# Altium schematic sheet CW341_FPGAIO_3.SchDoc: Kintex IO Banks
size Letter; Organization: NewAE Technology Inc.; Address1: 1083 Queen St., Suite 196; Address2: Halifax; Address3: NS; Address4: Canada B3H 0B2; DocumentNumber: .; Revision: .; SheetNumber: 8; SheetTotal: 16; SheetApproved: No
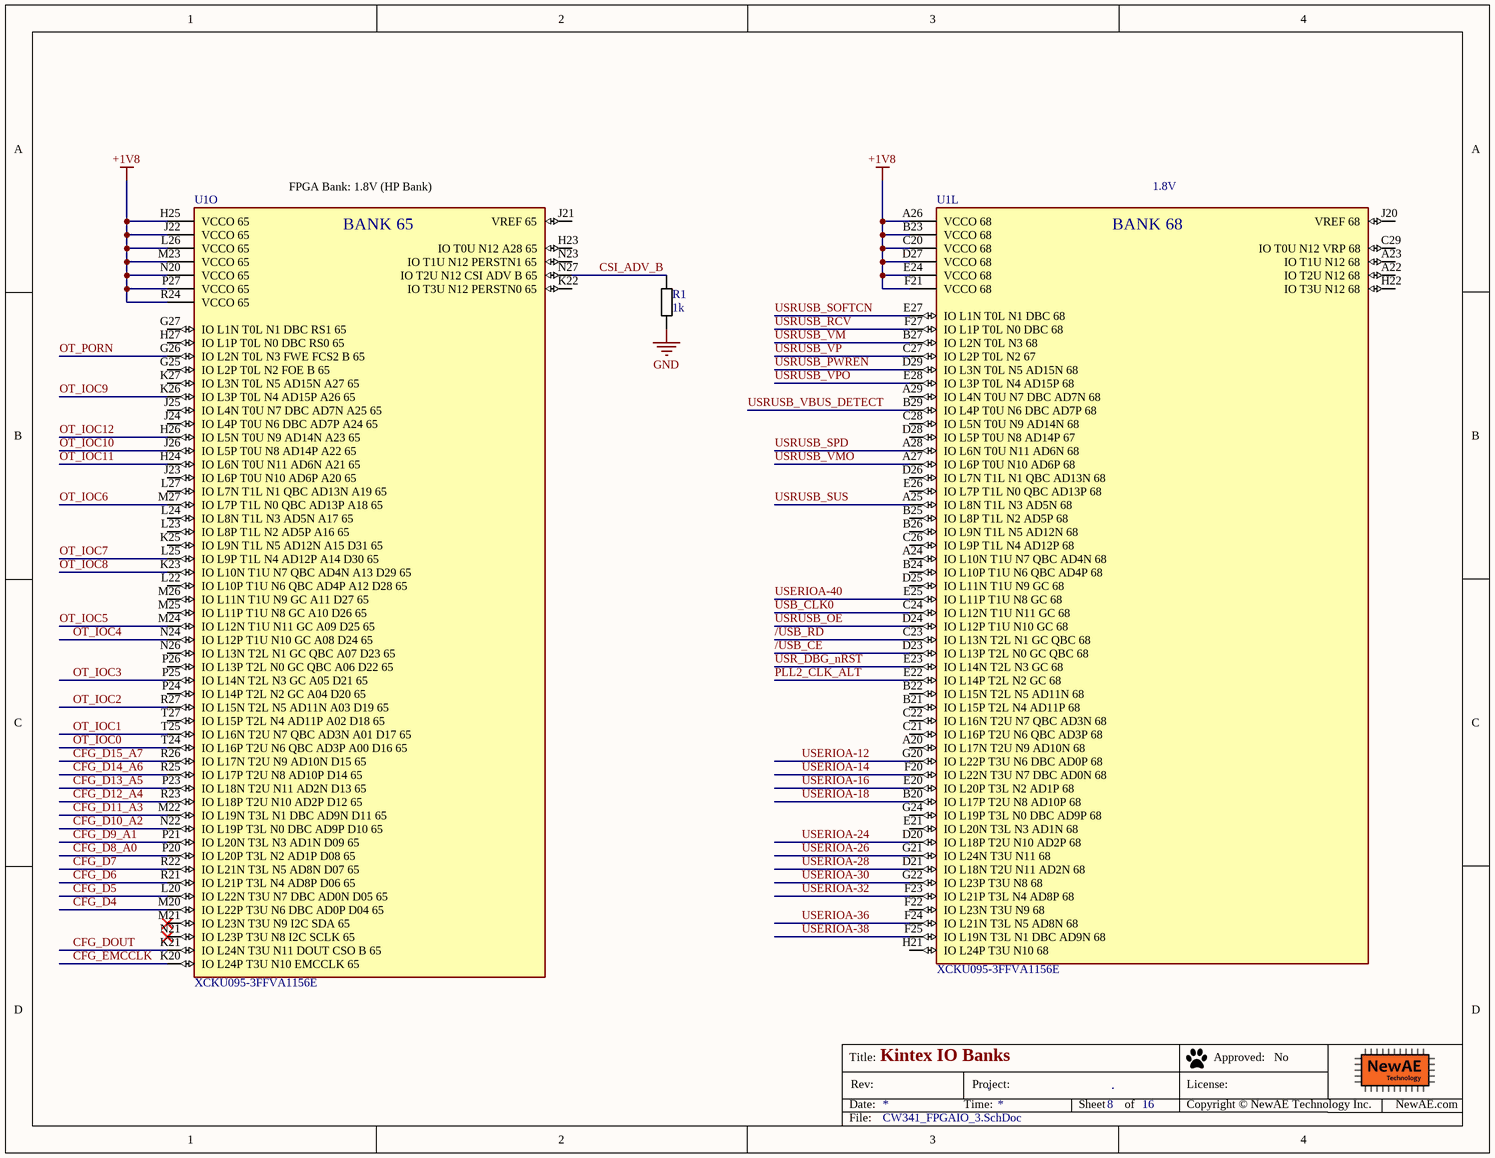
[diagram p0: CW341_FPGAIO_3.SchDoc]

## Parts
R1  1k  [RESC1005X40N]
U1  XCKU095-3FFVA1156E  [FP-XCKU060-3FFVA1156E-MFG]  (parts L,O of 23)

## Nets
+1V8: U1.A26(VCCO_68) U1.B23(VCCO_68) U1.C20(VCCO_68) U1.D27(VCCO_68) U1.E24(VCCO_68) U1.F21(VCCO_68) U1.H25(VCCO_65) U1.J22(VCCO_65) U1.L26(VCCO_65) U1.M23(VCCO_65) U1.N20(VCCO_65) U1.P27(VCCO_65) U1.R24(VCCO_65)
GND: R1.2
/USB_CE: U1.D23(IO_L13P_T2L_N0_GC_QBC_68)
/USB_RD: U1.C23(IO_L13N_T2L_N1_GC_QBC_68)
CFG_D4: U1.M20(IO_L22P_T3U_N6_DBC_AD0P_D04_65)
CFG_D5: U1.L20(IO_L22N_T3U_N7_DBC_AD0N_D05_65)
CFG_D6: U1.R21(IO_L21P_T3L_N4_AD8P_D06_65)
CFG_D7: U1.R22(IO_L21N_T3L_N5_AD8N_D07_65)
CFG_D8_A0: U1.P20(IO_L20P_T3L_N2_AD1P_D08_65)
CFG_D9_A1: U1.P21(IO_L20N_T3L_N3_AD1N_D09_65)
CFG_D10_A2: U1.N22(IO_L19P_T3L_N0_DBC_AD9P_D10_65)
CFG_D11_A3: U1.M22(IO_L19N_T3L_N1_DBC_AD9N_D11_65)
CFG_D12_A4: U1.R23(IO_L18P_T2U_N10_AD2P_D12_65)
CFG_D13_A5: U1.P23(IO_L18N_T2U_N11_AD2N_D13_65)
CFG_D14_A6: U1.R25(IO_L17P_T2U_N8_AD10P_D14_65)
CFG_D15_A7: U1.R26(IO_L17N_T2U_N9_AD10N_D15_65)
CFG_DOUT: U1.K21(IO_L24N_T3U_N11_DOUT_CSO_B_65)
CFG_EMCCLK: U1.K20(IO_L24P_T3U_N10_EMCCLK_65)
CSI_ADV_B: R1.1 U1.N27(IO_T2U_N12_CSI_ADV_B_65)
OT_IOC0: U1.T24(IO_L16P_T2U_N6_QBC_AD3P_A00_D16_65)
OT_IOC1: U1.T25(IO_L16N_T2U_N7_QBC_AD3N_A01_D17_65)
OT_IOC2: U1.R27(IO_L15N_T2L_N5_AD11N_A03_D19_65)
OT_IOC3: U1.P25(IO_L14N_T2L_N3_GC_A05_D21_65)
OT_IOC4: U1.N24(IO_L12P_T1U_N10_GC_A08_D24_65)
OT_IOC5: U1.M24(IO_L12N_T1U_N11_GC_A09_D25_65)
OT_IOC6: U1.M27(IO_L7P_T1L_N0_QBC_AD13P_A18_65)
OT_IOC7: U1.L25(IO_L9P_T1L_N4_AD12P_A14_D30_65)
OT_IOC8: U1.K23(IO_L10N_T1U_N7_QBC_AD4N_A13_D29_65)
OT_IOC9: U1.K26(IO_L3P_T0L_N4_AD15P_A26_65)
OT_IOC10: U1.J26(IO_L5P_T0U_N8_AD14P_A22_65)
OT_IOC11: U1.H24(IO_L6N_T0U_N11_AD6N_A21_65)
OT_IOC12: U1.H26(IO_L5N_T0U_N9_AD14N_A23_65)
OT_PORN: U1.G26(IO_L2N_T0L_N3_FWE_FCS2_B_65)
PLL2_CLK_ALT: U1.E22(IO_L14P_T2L_N2_GC_68)
USB_CLK0: U1.C24(IO_L12N_T1U_N11_GC_68)
USERIOA-12: U1.G20(IO_L22P_T3U_N6_DBC_AD0P_68)
USERIOA-14: U1.F20(IO_L22N_T3U_N7_DBC_AD0N_68)
USERIOA-16: U1.E20(IO_L20P_T3L_N2_AD1P_68)
USERIOA-18: U1.B20(IO_L17P_T2U_N8_AD10P_68)
USERIOA-24: U1.D20(IO_L18P_T2U_N10_AD2P_68)
USERIOA-26: U1.G21(IO_L24N_T3U_N11_68)
USERIOA-28: U1.D21(IO_L18N_T2U_N11_AD2N_68)
USERIOA-30: U1.G22(IO_L23P_T3U_N8_68)
USERIOA-32: U1.F23(IO_L21P_T3L_N4_AD8P_68)
USERIOA-36: U1.F24(IO_L21N_T3L_N5_AD8N_68)
USERIOA-38: U1.F25(IO_L19N_T3L_N1_DBC_AD9N_68)
USERIOA-40: U1.E25(IO_L11P_T1U_N8_GC_68)
USR_DBG_nRST: U1.E23(IO_L14N_T2L_N3_GC_68)
USRUSB_OE: U1.D24(IO_L12P_T1U_N10_GC_68)
USRUSB_PWREN: U1.D29(IO_L3N_T0L_N5_AD15N_68)
USRUSB_RCV: U1.F27(IO_L1P_T0L_N0_DBC_68)
USRUSB_SOFTCN: U1.E27(IO_L1N_T0L_N1_DBC_68)
USRUSB_SPD: U1.A28(IO_L6N_T0U_N11_AD6N_68)
USRUSB_SUS: U1.A25(IO_L8N_T1L_N3_AD5N_68)
USRUSB_VBUS_DETECT: U1.B29(IO_L4P_T0U_N6_DBC_AD7P_68)
USRUSB_VM: U1.B27(IO_L2N_T0L_N3_68)
USRUSB_VMO: U1.A27(IO_L6P_T0U_N10_AD6P_68)
USRUSB_VP: U1.C27(IO_L2P_T0L_N2_67)
USRUSB_VPO: U1.E28(IO_L3P_T0L_N4_AD15P_68)

Not connected (* = marked no-connect by the designer): U1 A20(IO_L17N_T2U_N9_AD10N_68) A22(IO_T2U_N12_68) A23(IO_T1U_N12_68) A24(IO_L10N_T1U_N7_QBC_AD4N_68) A29(IO_L4N_T0U_N7_DBC_AD7N_68) B21(IO_L15P_T2L_N4_AD11P_68) B22(IO_L15N_T2L_N5_AD11N_68) B24(IO_L10P_T1U_N6_QBC_AD4P_68) B25(IO_L8P_T1L_N2_AD5P_68) B26(IO_L9N_T1L_N5_AD12N_68) C21(IO_L16P_T2U_N6_QBC_AD3P_68) C22(IO_L16N_T2U_N7_QBC_AD3N_68) C26(IO_L9P_T1L_N4_AD12P_68) C28(IO_L5N_T0U_N9_AD14N_68) C29(IO_T0U_N12_VRP_68) D25(IO_L11N_T1U_N9_GC_68) D26(IO_L7N_T1L_N1_QBC_AD13N_68) D28(IO_L5P_T0U_N8_AD14P_67) E21(IO_L20N_T3L_N3_AD1N_68) E26(IO_L7P_T1L_N0_QBC_AD13P_68) F22(IO_L23N_T3U_N9_68) G24(IO_L19P_T3L_N0_DBC_AD9P_68) G25(IO_L2P_T0L_N2_FOE_B_65) G27(IO_L1N_T0L_N1_DBC_RS1_65) H21(IO_L24P_T3U_N10_68) H22(IO_T3U_N12_68) H23(IO_T0U_N12_A28_65) H27(IO_L1P_T0L_N0_DBC_RS0_65) J20(VREF_68) J21(VREF_65) J23(IO_L6P_T0U_N10_AD6P_A20_65) J24(IO_L4P_T0U_N6_DBC_AD7P_A24_65) J25(IO_L4N_T0U_N7_DBC_AD7N_A25_65) K22(IO_T3U_N12_PERSTN0_65) K25(IO_L9N_T1L_N5_AD12N_A15_D31_65) K27(IO_L3N_T0L_N5_AD15N_A27_65) L22(IO_L10P_T1U_N6_QBC_AD4P_A12_D28_65) L23(IO_L8P_T1L_N2_AD5P_A16_65) L24(IO_L8N_T1L_N3_AD5N_A17_65) L27(IO_L7N_T1L_N1_QBC_AD13N_A19_65) M21(IO_L23N_T3U_N9_I2C_SDA_65)* M25(IO_L11P_T1U_N8_GC_A10_D26_65) M26(IO_L11N_T1U_N9_GC_A11_D27_65) N21(IO_L23P_T3U_N8_I2C_SCLK_65)* N23(IO_T1U_N12_PERSTN1_65) N26(IO_L13N_T2L_N1_GC_QBC_A07_D23_65) P24(IO_L14P_T2L_N2_GC_A04_D20_65) P26(IO_L13P_T2L_N0_GC_QBC_A06_D22_65) T27(IO_L15P_T2L_N4_AD11P_A02_D18_65)

## Notes on the sheet
- (near U1) FPGA Bank: 1.8V (HP Bank)
- (near U1) 1.8V
- Title:
- Date:
- Rev:
- Time:
- Project:
- Sheet
- of
- License:
- Copyright © NewAE Technology Inc.
- Approved:
- NewAE.com
- File:
- (in symbol IC-XCKU095-1156, part L) BANK 68
- (in symbol IC-XCKU095-1156, part O) BANK 65

## Library data of the parts
R1 = RCHIP-1K-0402: 1k res, 0402, 1%, 1/16W; Manufacture 1: Yageo; Manufacture Part Number 1: RC0402FR-071KL; Component Group: Resistor; Case-EIA: 0402; Case-Metric: 1005; Rated Power: 0.063W; Rated Voltage: 75VDC; Part Number: RCHIP-1K-0402; Footprint: 0402; Pin Count: 2; Supplier 1: Digi-Key; Supplier Part Number 1: 311-1.00KLRCT-ND; Value: 1k; Tolerance: 1%; Mounting Technology: SMT; Temperature Range: -55C to 155C; Component Kind: Standard; Component Type: Standard
U1 = IC-XCKU095-1156: IC FPGA 520 I/O 1156FCBGA; Manufacturer: Xilinx; Manufacturer Part Number: XCKU060-3FFVA1156E; Standoff Height: 0.4mm; Ram Size: 38MBytes; Min Supply Voltage: 0.97V; Max Junction Temp: +100°C; Max Supply Voltage: 1.8V; Number Of Logic Elements Cells: 1176000; Number Of I/Os: 520; Speed Grade: 3; Memory Type: RAM; Ipc Land Pattern Name: BGA1156N100P34X34_3500X3500X342; RoHS: TRUE; Height: 3.51mm; Footprint Url: https://www.xilinx.com/support/documentation/user_guides/ug575-ultrascale-pkg-pinout.pdf; Device Class L2: Embedded Processors and Controllers; ComponentLink2URL: https://www.xilinx.com/support/documentation/data_sheets/ds890-ultrascale-overview.pdf; Temperature Range High: +100°C; Device Class L1: Integrated Circuits (ICs); Package: 0; Octopart: https://octopart.com/xcku035-3ffva1156e-xilinx-67038192?r=sp; Automotive: No; ComponentLink2Description: Datasheet; Device Class L3: FPGAs - Field Programmable Gate Arrays; Category: IC; Lead Free: Yes; Temperature: 0°C to +100°C; Temperature Range Low: 0°C; Digikey Description: IC FPGA 520 I/O 1156FCBGA